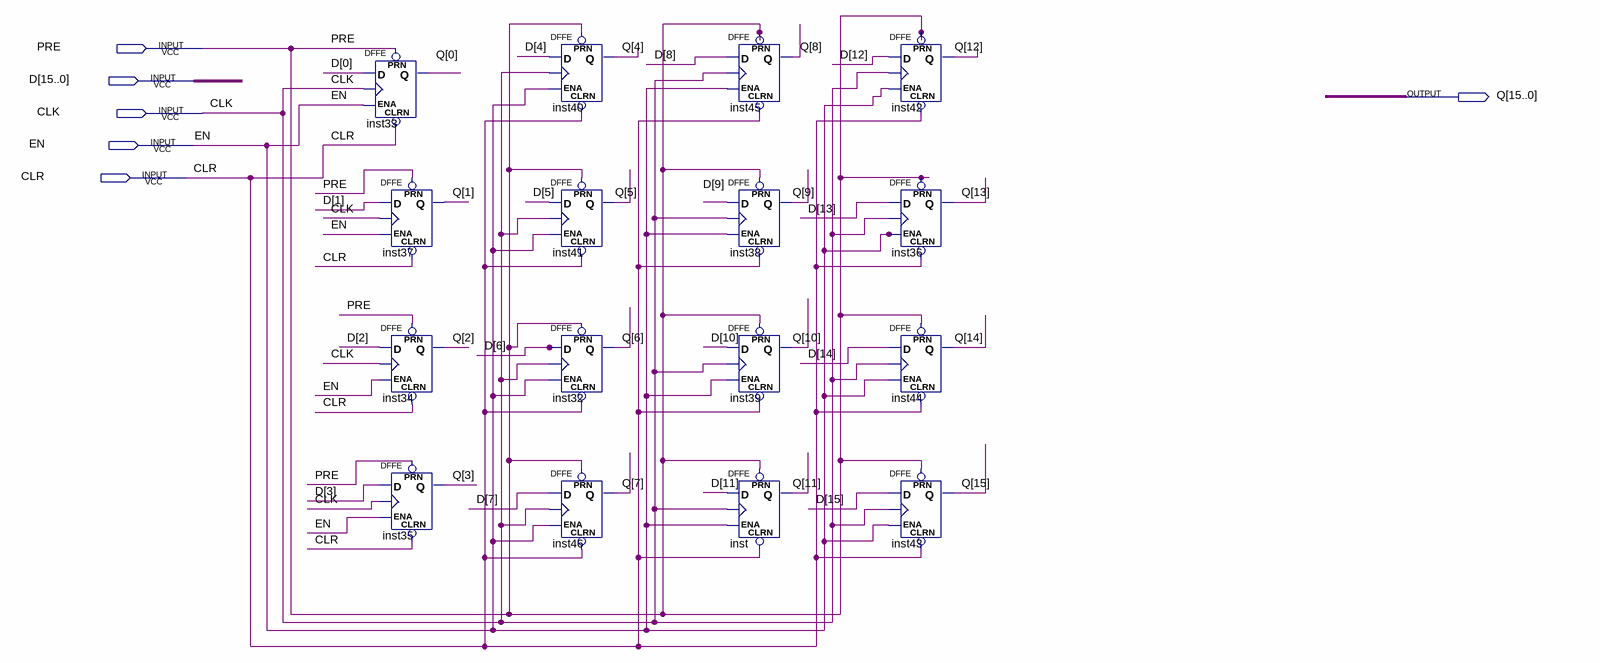
[diagram p0: schematic sheet]
// Quartus schematic reg_16bit.bdf as structural Verilog: 16 symbols, 6 pins
module reg_16bit (
  input  PRE,
  input  [15:0] D,
  input  CLK,
  input  EN,
  input  CLR,
  output [15:0] Q
);

  DFFE inst33 (.PRN(PRE), .CLRN(CLR), .D(D[0]), .CLK(CLK), .ENA(EN), .Q(Q[0]));
  DFFE inst37 (.PRN(PRE), .CLRN(CLR), .D(D[1]), .CLK(CLK), .ENA(EN), .Q(Q[1]));
  DFFE inst34 (.PRN(PRE), .CLRN(CLR), .D(D[2]), .CLK(CLK), .ENA(EN), .Q(Q[2]));
  DFFE inst35 (.PRN(PRE), .CLRN(CLR), .D(D[3]), .CLK(CLK), .ENA(EN), .Q(Q[3]));
  DFFE inst40 (.PRN(PRE), .CLRN(CLR), .D(D[4]), .CLK(CLK), .ENA(EN), .Q(Q[4]));
  DFFE inst41 (.PRN(PRE), .CLRN(CLR), .D(D[5]), .CLK(CLK), .ENA(EN), .Q(Q[5]));
  DFFE inst32 (.PRN(PRE), .CLRN(CLR), .D(D[6]), .CLK(CLK), .ENA(EN), .Q(Q[6]));
  DFFE inst46 (.PRN(PRE), .CLRN(CLR), .D(D[7]), .CLK(CLK), .ENA(EN), .Q(Q[7]));
  DFFE inst45 (.PRN(PRE), .CLRN(CLR), .D(D[8]), .CLK(CLK), .ENA(EN), .Q(Q[8]));
  DFFE inst38 (.PRN(PRE), .CLRN(CLR), .D(D[9]), .CLK(CLK), .ENA(EN), .Q(Q[9]));
  DFFE inst39 (.PRN(PRE), .CLRN(CLR), .D(D[10]), .CLK(CLK), .ENA(EN), .Q(Q[10]));
  DFFE inst (.PRN(PRE), .CLRN(CLR), .D(D[11]), .CLK(CLK), .ENA(EN), .Q(Q[11]));
  DFFE inst42 (.PRN(PRE), .CLRN(CLR), .D(D[12]), .CLK(CLK), .ENA(EN), .Q(Q[12]));
  DFFE inst36 (.PRN(PRE), .CLRN(CLR), .D(D[13]), .CLK(CLK), .ENA(EN), .Q(Q[13]));
  DFFE inst44 (.PRN(PRE), .CLRN(CLR), .D(D[14]), .CLK(CLK), .ENA(EN), .Q(Q[14]));
  DFFE inst43 (.PRN(PRE), .CLRN(CLR), .D(D[15]), .CLK(CLK), .ENA(EN), .Q(Q[15]));
endmodule
